# Altium schematic sheet ConnectionMain.SchDoc
size A4; SheetNumber: 1; SheetTotal: 5
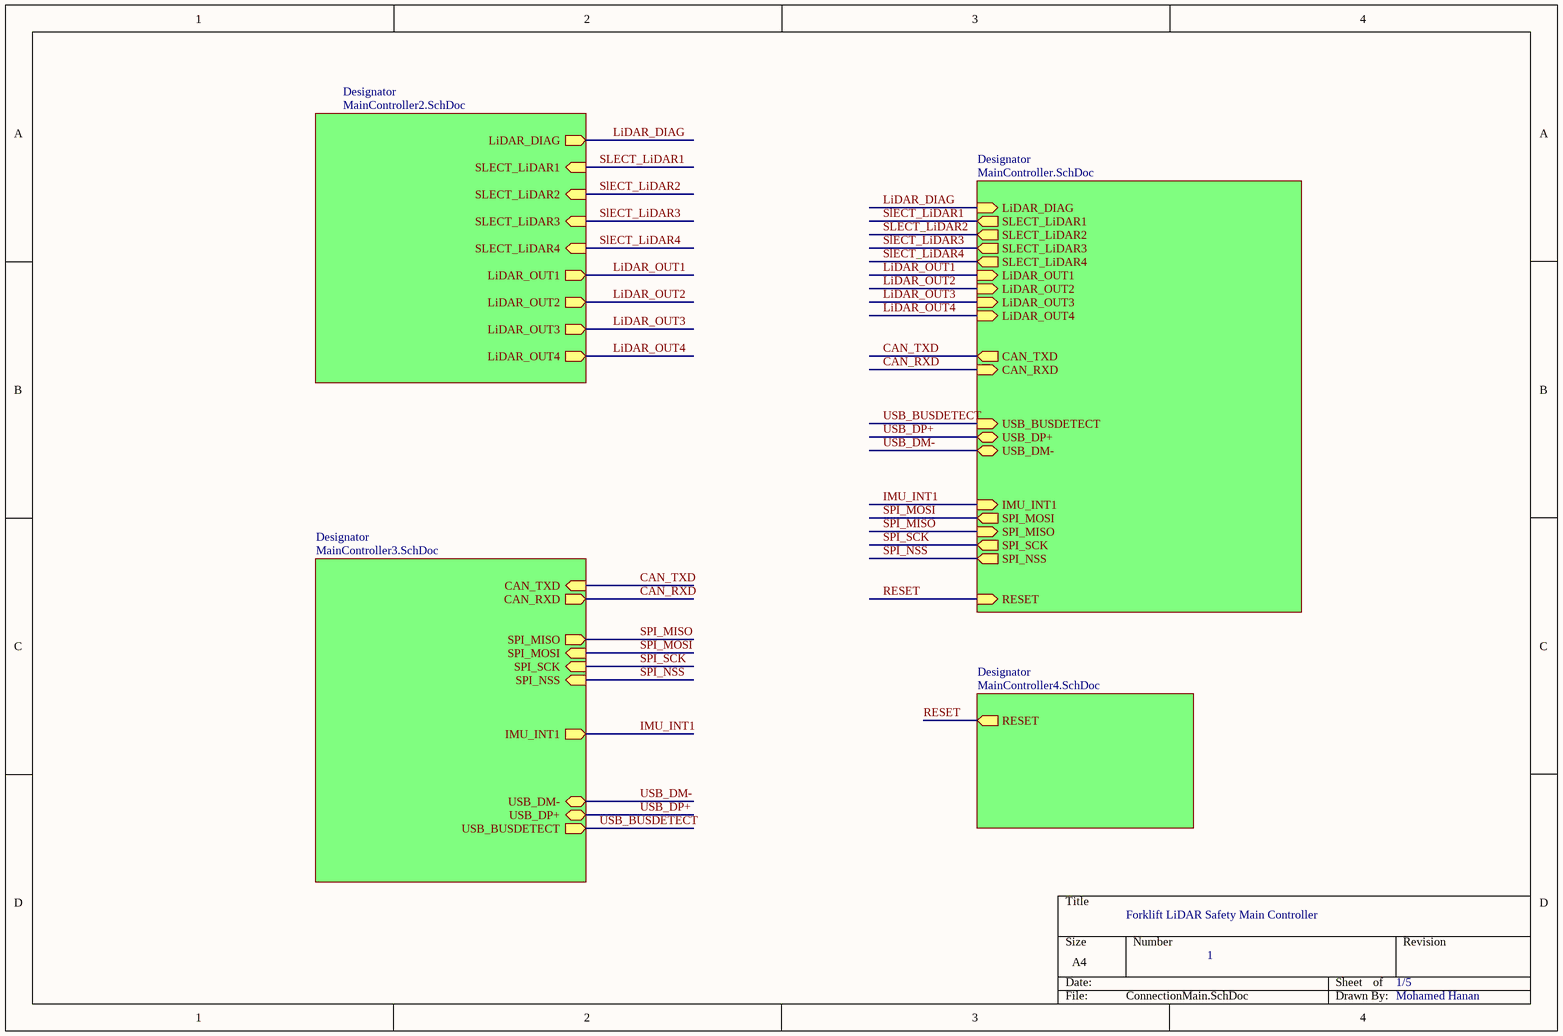
[diagram p0: ConnectionMain.SchDoc]

## Sub-sheets
Designator = MainController.SchDoc: LiDAR_DIAG (in), SLECT_LiDAR1 (out), SLECT_LiDAR2 (out), SLECT_LiDAR3 (out), SLECT_LiDAR4 (out), LiDAR_OUT1 (in), LiDAR_OUT2 (in), LiDAR_OUT3 (in), LiDAR_OUT4 (in), USB_DP+ (bidir), USB_DM- (bidir), IMU_INT1 (in), SPI_MOSI (out), SPI_MISO (in), SPI_SCK (out), SPI_NSS (out), CAN_TXD (out), CAN_RXD (in), USB_BUSDETECT (in), RESET (in)
Designator = MainController2.SchDoc: SLECT_LiDAR1 (in), SLECT_LiDAR2 (in), SLECT_LiDAR3 (in), SLECT_LiDAR4 (in), LiDAR_OUT1 (out), LiDAR_OUT2 (out), LiDAR_OUT3 (out), LiDAR_OUT4 (out), LiDAR_DIAG (out)
Designator = MainController3.SchDoc: CAN_TXD (in), CAN_RXD (out), USB_BUSDETECT (out), USB_DM- (bidir), USB_DP+ (bidir), IMU_INT1 (out), SPI_MISO (out), SPI_MOSI (in), SPI_SCK (in), SPI_NSS (in)
Designator = MainController4.SchDoc: RESET (out)

## Nets
CAN_RXD: sheet Designator/CAN_RXD, sheet Designator/CAN_RXD
CAN_TXD: sheet Designator/CAN_TXD, sheet Designator/CAN_TXD
IMU_INT1: sheet Designator/IMU_INT1, sheet Designator/IMU_INT1
LiDAR_DIAG: sheet Designator/LiDAR_DIAG, sheet Designator/LiDAR_DIAG
LiDAR_OUT1: sheet Designator/LiDAR_OUT1, sheet Designator/LiDAR_OUT1
LiDAR_OUT2: sheet Designator/LiDAR_OUT2, sheet Designator/LiDAR_OUT2
LiDAR_OUT3: sheet Designator/LiDAR_OUT3, sheet Designator/LiDAR_OUT3
LiDAR_OUT4: sheet Designator/LiDAR_OUT4, sheet Designator/LiDAR_OUT4
RESET: sheet Designator/RESET, sheet Designator/RESET
SLECT_LiDAR1: sheet Designator/SLECT_LiDAR1, sheet Designator/SLECT_LiDAR1
SlECT_LiDAR2: sheet Designator/SLECT_LiDAR2, sheet Designator/SLECT_LiDAR2
SlECT_LiDAR3: sheet Designator/SLECT_LiDAR3, sheet Designator/SLECT_LiDAR3
SlECT_LiDAR4: sheet Designator/SLECT_LiDAR4, sheet Designator/SLECT_LiDAR4
SPI_MISO: sheet Designator/SPI_MISO, sheet Designator/SPI_MISO
SPI_MOSI: sheet Designator/SPI_MOSI, sheet Designator/SPI_MOSI
SPI_NSS: sheet Designator/SPI_NSS, sheet Designator/SPI_NSS
SPI_SCK: sheet Designator/SPI_SCK, sheet Designator/SPI_SCK
USB_BUSDETECT: sheet Designator/USB_BUSDETECT, sheet Designator/USB_BUSDETECT
USB_DM-: sheet Designator/USB_DM-, sheet Designator/USB_DM-
USB_DP+: sheet Designator/USB_DP+, sheet Designator/USB_DP+

## Notes on the sheet
- Forklift LiDAR Safety Main Controller
- 1
- 1/5
- Mohamed Hanan